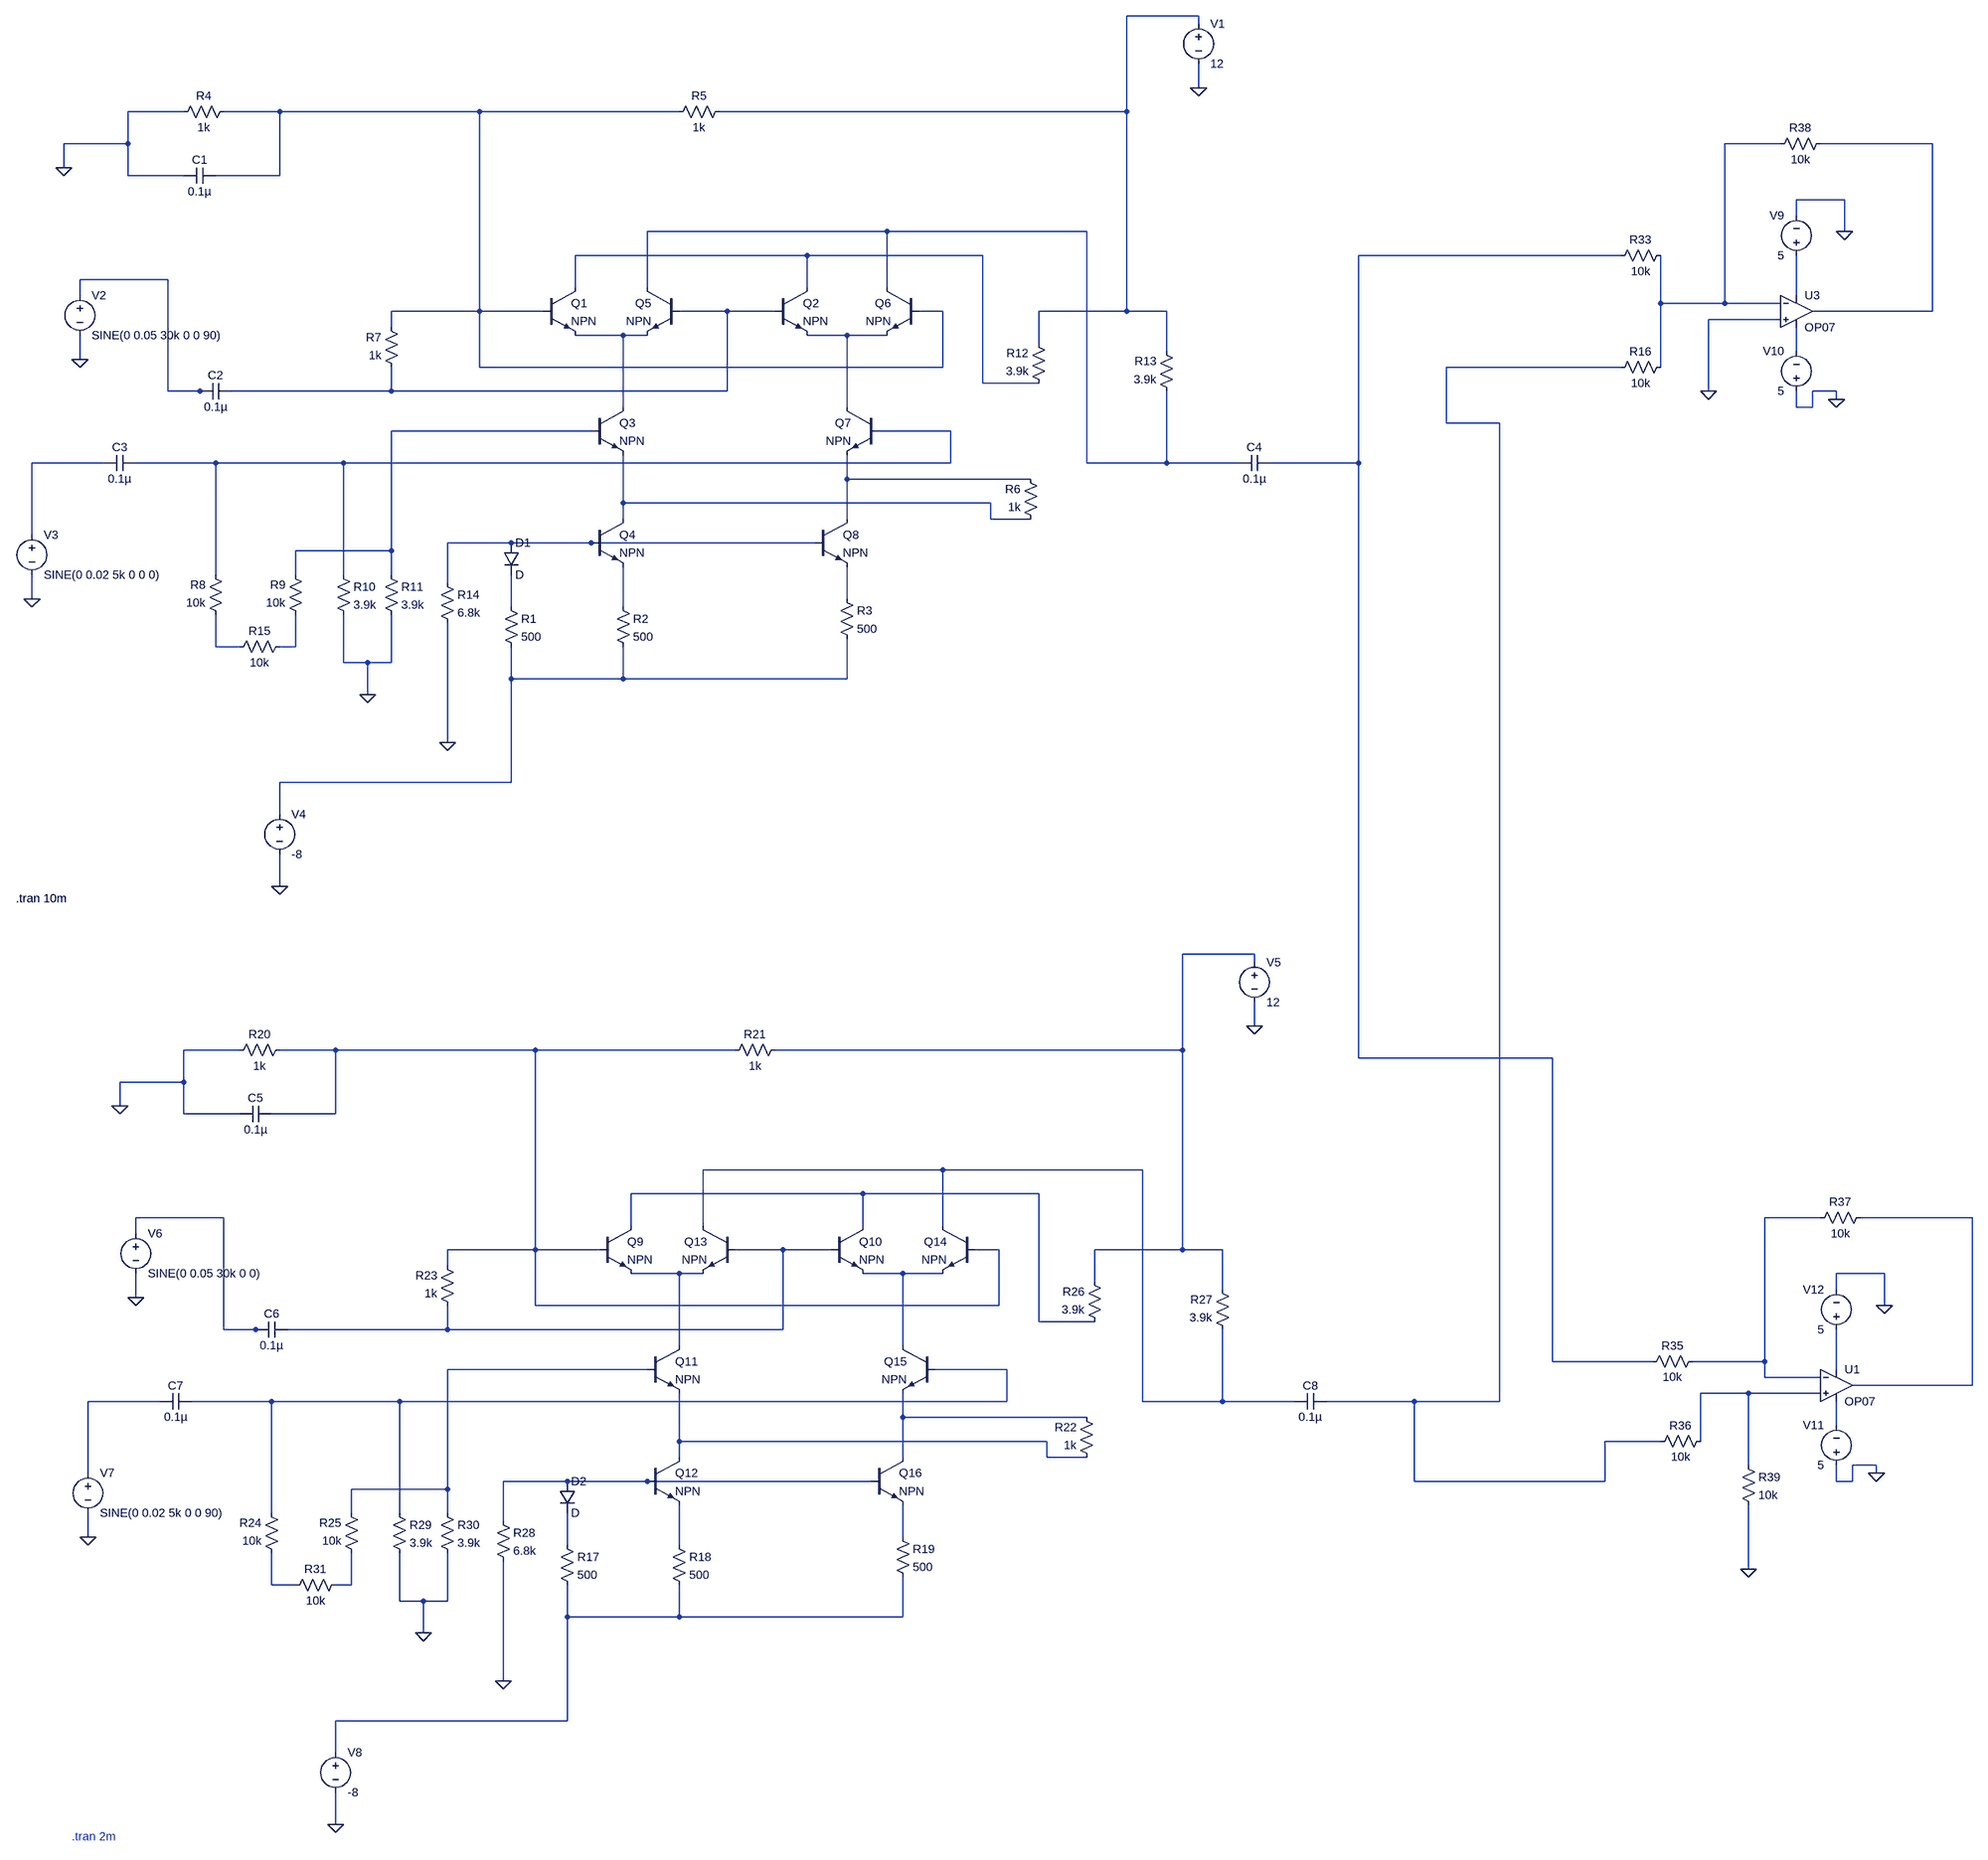
[diagram p0: schematic SSB-SC modulation and demodulation.asc]
SSB-SC modulation and demodulation.asc, the LTspice schematic file:
Version 4
SHEET 1 8160 3920
WIRE 1216 -1008 1072 -1008
WIRE 1216 -992 1216 -1008
WIRE 1216 -864 1216 -912
WIRE -816 -816 -928 -816
WIRE -624 -816 -736 -816
WIRE -224 -816 -624 -816
WIRE 176 -816 -224 -816
WIRE 1072 -816 1072 -1008
WIRE 1072 -816 256 -816
WIRE -928 -752 -928 -816
WIRE -928 -752 -1056 -752
WIRE 2528 -752 2416 -752
WIRE 2832 -752 2608 -752
WIRE -1056 -704 -1056 -752
WIRE -928 -688 -928 -752
WIRE -816 -688 -928 -688
WIRE -624 -688 -624 -816
WIRE -624 -688 -752 -688
WIRE 2656 -640 2560 -640
WIRE 2560 -608 2560 -640
WIRE 592 -576 112 -576
WIRE 992 -576 592 -576
WIRE 2656 -576 2656 -640
WIRE 432 -528 -32 -528
WIRE 784 -528 432 -528
WIRE 2208 -528 1536 -528
WIRE -848 -480 -1024 -480
WIRE -32 -464 -32 -528
WIRE 112 -464 112 -576
WIRE 432 -464 432 -528
WIRE 592 -464 592 -576
WIRE -1024 -448 -1024 -480
WIRE 2560 -448 2560 -528
WIRE 2288 -432 2288 -528
WIRE 2416 -432 2416 -752
WIRE 2416 -432 2288 -432
WIRE 2528 -432 2416 -432
WIRE -224 -416 -224 -816
WIRE -224 -416 -400 -416
WIRE -96 -416 -224 -416
WIRE 272 -416 176 -416
WIRE 368 -416 272 -416
WIRE 704 -416 656 -416
WIRE 1072 -416 1072 -816
WIRE 1072 -416 896 -416
WIRE 1152 -416 1072 -416
WIRE 2832 -416 2832 -752
WIRE 2832 -416 2592 -416
WIRE 2528 -400 2384 -400
WIRE -400 -384 -400 -416
WIRE 64 -368 -32 -368
WIRE 112 -368 64 -368
WIRE 512 -368 432 -368
WIRE 592 -368 512 -368
WIRE 896 -352 896 -416
WIRE 1152 -336 1152 -416
WIRE 2560 -336 2560 -384
WIRE -1024 -320 -1024 -368
WIRE -224 -304 -224 -416
WIRE 704 -304 704 -416
WIRE 704 -304 -224 -304
WIRE 2208 -304 1712 -304
WIRE 2288 -304 2288 -432
WIRE 784 -272 784 -528
WIRE 896 -272 784 -272
WIRE -848 -256 -848 -480
WIRE -784 -256 -848 -256
WIRE -768 -256 -784 -256
WIRE -400 -256 -400 -304
WIRE -400 -256 -720 -256
WIRE 272 -256 272 -416
WIRE 272 -256 -400 -256
WIRE 2384 -256 2384 -400
WIRE 2640 -256 2592 -256
WIRE 2640 -240 2640 -256
WIRE 64 -224 64 -368
WIRE 512 -224 512 -368
WIRE 2560 -224 2560 -256
WIRE 2592 -224 2592 -256
WIRE 2592 -224 2560 -224
WIRE 1712 -192 1712 -304
WIRE 1872 -192 1712 -192
WIRE 0 -176 -400 -176
WIRE 720 -176 576 -176
WIRE -976 -112 -1120 -112
WIRE -752 -112 -912 -112
WIRE -496 -112 -752 -112
WIRE 720 -112 720 -176
WIRE 720 -112 -496 -112
WIRE 992 -112 992 -576
WIRE 1152 -112 1152 -256
WIRE 1152 -112 992 -112
WIRE 1296 -112 1152 -112
WIRE 1536 -112 1536 -528
WIRE 1536 -112 1360 -112
WIRE 512 -80 512 -128
WIRE 880 -80 512 -80
WIRE 64 -32 64 -128
WIRE 800 -32 64 -32
WIRE 64 0 64 -32
WIRE 512 0 512 -80
WIRE 800 0 800 -32
WIRE 880 0 800 0
WIRE -1120 32 -1120 -112
WIRE -160 48 -288 48
WIRE 0 48 -160 48
WIRE 448 48 0 48
WIRE -400 64 -400 -176
WIRE -400 64 -592 64
WIRE -752 112 -752 -112
WIRE -592 112 -592 64
WIRE -496 112 -496 -112
WIRE -400 112 -400 64
WIRE -288 128 -288 48
WIRE -1120 160 -1120 112
WIRE 512 160 512 96
WIRE -160 176 -160 112
WIRE 64 176 64 96
WIRE -752 256 -752 192
WIRE -704 256 -752 256
WIRE -592 256 -592 192
WIRE -592 256 -624 256
WIRE -496 288 -496 192
WIRE -448 288 -496 288
WIRE -400 288 -400 192
WIRE -400 288 -448 288
WIRE -160 320 -160 256
WIRE 64 320 64 256
WIRE 64 320 -160 320
WIRE 512 320 512 240
WIRE 512 320 64 320
WIRE -448 352 -448 288
WIRE -288 448 -288 208
WIRE -160 528 -160 320
WIRE -160 528 -624 528
WIRE -624 592 -624 528
WIRE -624 736 -624 672
WIRE 1328 944 1184 944
WIRE 1328 960 1328 944
WIRE 1328 1088 1328 1040
WIRE -704 1136 -816 1136
WIRE -512 1136 -624 1136
WIRE -112 1136 -512 1136
WIRE 288 1136 -112 1136
WIRE 1184 1136 1184 944
WIRE 1184 1136 368 1136
WIRE 1536 1152 1536 -112
WIRE 2048 1152 1536 1152
WIRE -816 1200 -816 1136
WIRE -816 1200 -944 1200
WIRE -944 1248 -944 1200
WIRE -816 1264 -816 1200
WIRE -704 1264 -816 1264
WIRE -512 1264 -512 1136
WIRE -512 1264 -640 1264
WIRE 704 1376 224 1376
WIRE 1104 1376 704 1376
WIRE 544 1424 80 1424
WIRE 896 1424 544 1424
WIRE -736 1472 -912 1472
WIRE 2608 1472 2496 1472
WIRE 2912 1472 2688 1472
WIRE 80 1488 80 1424
WIRE 224 1488 224 1376
WIRE 544 1488 544 1424
WIRE 704 1488 704 1376
WIRE -912 1504 -912 1472
WIRE -112 1536 -112 1136
WIRE -112 1536 -288 1536
WIRE 16 1536 -112 1536
WIRE 384 1536 288 1536
WIRE 480 1536 384 1536
WIRE 816 1536 768 1536
WIRE 1184 1536 1184 1136
WIRE 1184 1536 1008 1536
WIRE 1264 1536 1184 1536
WIRE -288 1568 -288 1536
WIRE 176 1584 80 1584
WIRE 224 1584 176 1584
WIRE 624 1584 544 1584
WIRE 704 1584 624 1584
WIRE 2736 1584 2640 1584
WIRE 1008 1600 1008 1536
WIRE 1264 1616 1264 1536
WIRE 2640 1616 2640 1584
WIRE -912 1632 -912 1584
WIRE -112 1648 -112 1536
WIRE 816 1648 816 1536
WIRE 816 1648 -112 1648
WIRE 2736 1648 2736 1584
WIRE 896 1680 896 1424
WIRE 1008 1680 896 1680
WIRE -736 1696 -736 1472
WIRE -672 1696 -736 1696
WIRE -656 1696 -672 1696
WIRE -288 1696 -288 1648
WIRE -288 1696 -608 1696
WIRE 384 1696 384 1536
WIRE 384 1696 -288 1696
WIRE 176 1728 176 1584
WIRE 624 1728 624 1584
WIRE 2048 1760 2048 1152
WIRE 2272 1760 2048 1760
WIRE 2496 1760 2496 1472
WIRE 2496 1760 2352 1760
WIRE 112 1776 -288 1776
WIRE 832 1776 688 1776
WIRE 2640 1776 2640 1696
WIRE 2496 1792 2496 1760
WIRE 2608 1792 2496 1792
WIRE 2912 1808 2912 1472
WIRE 2912 1808 2672 1808
WIRE 2464 1824 2368 1824
WIRE 2608 1824 2464 1824
WIRE -864 1840 -1008 1840
WIRE -640 1840 -800 1840
WIRE -384 1840 -640 1840
WIRE 832 1840 832 1776
WIRE 832 1840 -384 1840
WIRE 1104 1840 1104 1376
WIRE 1264 1840 1264 1696
WIRE 1264 1840 1104 1840
WIRE 1408 1840 1264 1840
WIRE 1648 1840 1472 1840
WIRE 1872 1840 1872 -192
WIRE 1872 1840 1648 1840
WIRE 624 1872 624 1824
WIRE 992 1872 624 1872
WIRE 2640 1888 2640 1840
WIRE 176 1920 176 1824
WIRE 912 1920 176 1920
WIRE 2288 1920 2176 1920
WIRE 2368 1920 2368 1824
WIRE 176 1952 176 1920
WIRE 624 1952 624 1872
WIRE 912 1952 912 1920
WIRE 992 1952 912 1952
WIRE 2464 1968 2464 1824
WIRE 2720 1968 2672 1968
WIRE -1008 1984 -1008 1840
WIRE 2720 1984 2720 1968
WIRE -48 2000 -176 2000
WIRE 112 2000 -48 2000
WIRE 560 2000 112 2000
WIRE 1648 2000 1648 1840
WIRE 2176 2000 2176 1920
WIRE 2176 2000 1648 2000
WIRE 2640 2000 2640 1968
WIRE 2672 2000 2672 1968
WIRE 2672 2000 2640 2000
WIRE -288 2016 -288 1776
WIRE -288 2016 -480 2016
WIRE -640 2064 -640 1840
WIRE -480 2064 -480 2016
WIRE -384 2064 -384 1840
WIRE -288 2064 -288 2016
WIRE -176 2080 -176 2000
WIRE -1008 2112 -1008 2064
WIRE 624 2112 624 2048
WIRE -48 2128 -48 2064
WIRE 176 2128 176 2048
WIRE 2464 2176 2464 2048
WIRE -640 2208 -640 2144
WIRE -592 2208 -640 2208
WIRE -480 2208 -480 2144
WIRE -480 2208 -512 2208
WIRE -384 2240 -384 2144
WIRE -336 2240 -384 2240
WIRE -288 2240 -288 2144
WIRE -288 2240 -336 2240
WIRE -48 2272 -48 2208
WIRE 176 2272 176 2208
WIRE 176 2272 -48 2272
WIRE 624 2272 624 2192
WIRE 624 2272 176 2272
WIRE -336 2304 -336 2240
WIRE -176 2400 -176 2160
WIRE -48 2480 -48 2272
WIRE -48 2480 -512 2480
WIRE -512 2544 -512 2480
WIRE -512 2688 -512 2624
FLAG -288 448 0
FLAG -448 352 0
FLAG 1216 -864 0
FLAG -1024 -320 0
FLAG -1120 160 0
FLAG -1056 -704 0
FLAG -624 736 0
FLAG -176 2400 0
FLAG -336 2304 0
FLAG 1328 1088 0
FLAG -912 1632 0
FLAG -1008 2112 0
FLAG -944 1248 0
FLAG -512 2688 0
FLAG 2656 -576 0
FLAG 2640 -240 0
FLAG 2384 -256 0
FLAG 2736 1648 0
FLAG 2720 1984 0
FLAG 2464 2176 0
SYMBOL npn -96 -464 R0
SYMATTR InstName Q1
SYMBOL npn 368 -464 R0
SYMATTR InstName Q2
SYMBOL npn 0 -224 R0
SYMATTR InstName Q3
SYMBOL npn 0 0 R0
SYMATTR InstName Q4
SYMBOL npn 176 -464 M0
SYMATTR InstName Q5
SYMBOL npn 656 -464 M0
SYMATTR InstName Q6
SYMBOL npn 576 -224 M0
SYMATTR InstName Q7
SYMBOL diode -176 48 R0
SYMATTR InstName D1
SYMBOL res -176 160 R0
SYMATTR InstName R1
SYMATTR Value 500
SYMBOL res 48 160 R0
SYMATTR InstName R2
SYMATTR Value 500
SYMBOL npn 448 0 R0
SYMATTR InstName Q8
SYMBOL res 496 144 R0
SYMATTR InstName R3
SYMATTR Value 500
SYMBOL res -720 -832 R90
WINDOW 0 0 56 VBottom 2
WINDOW 3 32 56 VTop 2
SYMATTR InstName R4
SYMATTR Value 1k
SYMBOL res 272 -832 R90
WINDOW 0 0 56 VBottom 2
WINDOW 3 32 56 VTop 2
SYMATTR InstName R5
SYMATTR Value 1k
SYMBOL res 896 16 R180
WINDOW 0 36 76 Left 2
WINDOW 3 36 40 Left 2
SYMATTR InstName R6
SYMATTR Value 1k
SYMBOL res -384 -288 R180
WINDOW 0 36 76 Left 2
WINDOW 3 36 40 Left 2
SYMATTR InstName R7
SYMATTR Value 1k
SYMBOL res -736 208 R180
WINDOW 0 36 76 Left 2
WINDOW 3 36 40 Left 2
SYMATTR InstName R8
SYMATTR Value 10k
SYMBOL res -576 208 R180
WINDOW 0 36 76 Left 2
WINDOW 3 36 40 Left 2
SYMATTR InstName R9
SYMATTR Value 10k
SYMBOL res 912 -256 R180
WINDOW 0 36 76 Left 2
WINDOW 3 36 40 Left 2
SYMATTR InstName R12
SYMATTR Value 3.9k
SYMBOL res 1168 -240 R180
WINDOW 0 36 76 Left 2
WINDOW 3 36 40 Left 2
SYMATTR InstName R13
SYMATTR Value 3.9k
SYMBOL cap -752 -704 R90
WINDOW 0 0 32 VBottom 2
WINDOW 3 32 32 VTop 2
SYMATTR InstName C1
SYMATTR Value 0.1µ
SYMBOL cap -720 -272 R90
WINDOW 0 0 32 VBottom 2
WINDOW 3 32 32 VTop 2
SYMATTR InstName C2
SYMATTR Value 0.1µ
SYMBOL cap -912 -128 R90
WINDOW 0 0 32 VBottom 2
WINDOW 3 32 32 VTop 2
SYMATTR InstName C3
SYMATTR Value 0.1µ
SYMBOL cap 1360 -128 R90
WINDOW 0 0 32 VBottom 2
WINDOW 3 32 32 VTop 2
SYMATTR InstName C4
SYMATTR Value 0.1µ
SYMBOL res -304 112 R0
SYMATTR InstName R14
SYMATTR Value 6.8k
SYMBOL res -512 96 R0
SYMATTR InstName R10
SYMATTR Value 3.9k
SYMBOL res -416 96 R0
SYMATTR InstName R11
SYMATTR Value 3.9k
SYMBOL voltage 1216 -1008 R0
WINDOW 123 0 0 Left 0
WINDOW 39 0 0 Left 0
SYMATTR InstName V1
SYMATTR Value 12
SYMBOL voltage -1024 -464 R0
WINDOW 123 0 0 Left 0
WINDOW 39 0 0 Left 0
SYMATTR InstName V2
SYMATTR Value SINE(0 0.05 30k 0 0 90)
SYMBOL voltage -1120 16 R0
WINDOW 123 0 0 Left 0
WINDOW 39 0 0 Left 0
SYMATTR InstName V3
SYMATTR Value SINE(0 0.02 5k 0 0 0)
SYMBOL res -608 240 R90
WINDOW 0 0 56 VBottom 2
WINDOW 3 32 56 VTop 2
SYMATTR InstName R15
SYMATTR Value 10k
SYMBOL voltage -624 576 R0
WINDOW 123 0 0 Left 0
WINDOW 39 0 0 Left 0
SYMATTR InstName V4
SYMATTR Value -8
SYMBOL npn 16 1488 R0
SYMATTR InstName Q9
SYMBOL npn 480 1488 R0
SYMATTR InstName Q10
SYMBOL npn 112 1728 R0
SYMATTR InstName Q11
SYMBOL npn 112 1952 R0
SYMATTR InstName Q12
SYMBOL npn 288 1488 M0
SYMATTR InstName Q13
SYMBOL npn 768 1488 M0
SYMATTR InstName Q14
SYMBOL npn 688 1728 M0
SYMATTR InstName Q15
SYMBOL diode -64 2000 R0
SYMATTR InstName D2
SYMBOL res -64 2112 R0
SYMATTR InstName R17
SYMATTR Value 500
SYMBOL res 160 2112 R0
SYMATTR InstName R18
SYMATTR Value 500
SYMBOL npn 560 1952 R0
SYMATTR InstName Q16
SYMBOL res 608 2096 R0
SYMATTR InstName R19
SYMATTR Value 500
SYMBOL res -608 1120 R90
WINDOW 0 0 56 VBottom 2
WINDOW 3 32 56 VTop 2
SYMATTR InstName R20
SYMATTR Value 1k
SYMBOL res 384 1120 R90
WINDOW 0 0 56 VBottom 2
WINDOW 3 32 56 VTop 2
SYMATTR InstName R21
SYMATTR Value 1k
SYMBOL res 1008 1968 R180
WINDOW 0 36 76 Left 2
WINDOW 3 36 40 Left 2
SYMATTR InstName R22
SYMATTR Value 1k
SYMBOL res -272 1664 R180
WINDOW 0 36 76 Left 2
WINDOW 3 36 40 Left 2
SYMATTR InstName R23
SYMATTR Value 1k
SYMBOL res -624 2160 R180
WINDOW 0 36 76 Left 2
WINDOW 3 36 40 Left 2
SYMATTR InstName R24
SYMATTR Value 10k
SYMBOL res -464 2160 R180
WINDOW 0 36 76 Left 2
WINDOW 3 36 40 Left 2
SYMATTR InstName R25
SYMATTR Value 10k
SYMBOL res 1024 1696 R180
WINDOW 0 36 76 Left 2
WINDOW 3 36 40 Left 2
SYMATTR InstName R26
SYMATTR Value 3.9k
SYMBOL res 1280 1712 R180
WINDOW 0 36 76 Left 2
WINDOW 3 36 40 Left 2
SYMATTR InstName R27
SYMATTR Value 3.9k
SYMBOL cap -640 1248 R90
WINDOW 0 0 32 VBottom 2
WINDOW 3 32 32 VTop 2
SYMATTR InstName C5
SYMATTR Value 0.1µ
SYMBOL cap -608 1680 R90
WINDOW 0 0 32 VBottom 2
WINDOW 3 32 32 VTop 2
SYMATTR InstName C6
SYMATTR Value 0.1µ
SYMBOL cap -800 1824 R90
WINDOW 0 0 32 VBottom 2
WINDOW 3 32 32 VTop 2
SYMATTR InstName C7
SYMATTR Value 0.1µ
SYMBOL cap 1472 1824 R90
WINDOW 0 0 32 VBottom 2
WINDOW 3 32 32 VTop 2
SYMATTR InstName C8
SYMATTR Value 0.1µ
SYMBOL res -192 2064 R0
SYMATTR InstName R28
SYMATTR Value 6.8k
SYMBOL res -400 2048 R0
SYMATTR InstName R29
SYMATTR Value 3.9k
SYMBOL res -304 2048 R0
SYMATTR InstName R30
SYMATTR Value 3.9k
SYMBOL voltage 1328 944 R0
WINDOW 123 0 0 Left 0
WINDOW 39 0 0 Left 0
SYMATTR InstName V5
SYMATTR Value 12
SYMBOL voltage -912 1488 R0
WINDOW 123 0 0 Left 0
WINDOW 39 0 0 Left 0
SYMATTR InstName V6
SYMATTR Value SINE(0 0.05 30k 0 0)
SYMBOL voltage -1008 1968 R0
WINDOW 123 0 0 Left 0
WINDOW 39 0 0 Left 0
SYMATTR InstName V7
SYMATTR Value SINE(0 0.02 5k 0 0 90)
SYMBOL res -496 2192 R90
WINDOW 0 0 56 VBottom 2
WINDOW 3 32 56 VTop 2
SYMATTR InstName R31
SYMATTR Value 10k
SYMBOL voltage -512 2528 R0
WINDOW 123 0 0 Left 0
WINDOW 39 0 0 Left 0
SYMATTR InstName V8
SYMATTR Value -8
SYMBOL OpAmps\\OP07 2560 -480 R0
SYMATTR InstName U3
SYMBOL res 2192 -512 R270
WINDOW 0 32 56 VTop 2
WINDOW 3 0 56 VBottom 2
SYMATTR InstName R33
SYMATTR Value 10k
SYMBOL res 2624 -768 R90
WINDOW 0 0 56 VBottom 2
WINDOW 3 32 56 VTop 2
SYMATTR InstName R38
SYMATTR Value 10k
SYMBOL voltage 2560 -240 R180
WINDOW 0 24 96 Left 2
WINDOW 3 24 16 Left 2
WINDOW 123 0 0 Left 0
WINDOW 39 0 0 Left 0
SYMATTR InstName V10
SYMATTR Value 5
SYMBOL voltage 2560 -512 R180
WINDOW 0 24 96 Left 2
WINDOW 3 24 16 Left 2
WINDOW 123 0 0 Left 0
WINDOW 39 0 0 Left 0
SYMATTR InstName V9
SYMATTR Value 5
SYMBOL OpAmps\\OP07 2640 1744 R0
SYMATTR InstName U1
SYMBOL res 2384 1904 R90
WINDOW 0 0 56 VBottom 2
WINDOW 3 32 56 VTop 2
SYMATTR InstName R36
SYMATTR Value 10k
SYMBOL res 2704 1456 R90
WINDOW 0 0 56 VBottom 2
WINDOW 3 32 56 VTop 2
SYMATTR InstName R37
SYMATTR Value 10k
SYMBOL voltage 2640 1984 R180
WINDOW 0 24 96 Left 2
WINDOW 3 24 16 Left 2
WINDOW 123 0 0 Left 0
WINDOW 39 0 0 Left 0
SYMATTR InstName V11
SYMATTR Value 5
SYMBOL voltage 2640 1712 R180
WINDOW 0 24 96 Left 2
WINDOW 3 24 16 Left 2
WINDOW 123 0 0 Left 0
WINDOW 39 0 0 Left 0
SYMATTR InstName V12
SYMATTR Value 5
SYMBOL res 2368 1744 R90
WINDOW 0 0 56 VBottom 2
WINDOW 3 32 56 VTop 2
SYMATTR InstName R35
SYMATTR Value 10k
SYMBOL res 2448 1952 R0
SYMATTR InstName R39
SYMATTR Value 10k
SYMBOL res 2304 -320 R90
WINDOW 0 0 56 VBottom 2
WINDOW 3 32 56 VTop 2
SYMATTR InstName R16
SYMATTR Value 10k
TEXT -1152 760 Left 2 !.tran 10m
TEXT -1040 2712 Left 2 ;.tran 2m

The netlist it stands for:
* SSB-SC modulation and demodulation.asc
Q1 N006 N002 N011 0 NPN
Q2 N006 N010 N012 0 NPN
Q3 N011 N015 N019 0 NPN
Q4 N019 N020 N023 0 NPN
Q5 N005 N010 N011 0 NPN
Q6 N005 N002 N012 0 NPN
Q7 N012 N016 N018 0 NPN
D1 N020 N022 D
R1 N022 N026 500
R2 N023 N026 500
Q8 N018 N020 N021 0 NPN
R3 N021 N026 500
R4 N002 0 1k
R5 N001 N002 1k
R6 N019 N018 1k
R7 N010 N002 1k
R8 N024 N016 10k
R9 N025 N015 10k
R12 N006 N001 3.9k
R13 N005 N001 3.9k
C1 N002 0 0.1µ
C2 N010 N008 0.1µ
C3 N016 N017 0.1µ
C4 N007 N005 0.1µ
R14 N020 0 6.8k
R10 N016 0 3.9k
R11 N015 0 3.9k
V1 N001 0 12
V2 N008 0 SINE(0 0.05 30k 0 0 90)
V3 N017 0 SINE(0 0.02 5k 0 0 0)
R15 N025 N024 10k
V4 N026 0 -8
Q9 N030 N028 N035 0 NPN
Q10 N030 N034 N036 0 NPN
Q11 N035 N037 N044 0 NPN
Q12 N044 N045 N048 0 NPN
Q13 N029 N034 N035 0 NPN
Q14 N029 N028 N036 0 NPN
Q15 N036 N038 N042 0 NPN
D2 N045 N047 D
R17 N047 N051 500
R18 N048 N051 500
Q16 N042 N045 N046 0 NPN
R19 N046 N051 500
R20 N028 0 1k
R21 N027 N028 1k
R22 N044 N042 1k
R23 N034 N028 1k
R24 N049 N038 10k
R25 N050 N037 10k
R26 N030 N027 3.9k
R27 N029 N027 3.9k
C5 N028 0 0.1µ
C6 N034 N031 0.1µ
C7 N038 N041 0.1µ
C8 N014 N029 0.1µ
R28 N045 0 6.8k
R29 N038 0 3.9k
R30 N037 0 3.9k
V5 N027 0 12
V6 N031 0 SINE(0 0.05 30k 0 0)
V7 N041 0 SINE(0 0.02 5k 0 0 90)
R31 N050 N049 10k
V8 N051 0 -8
XU3 0 N003 N009 N013 N004 LT1001  ; OP07, pins In+ In- V+ V- OUT
R33 N007 N003 10k
R38 N004 N003 10k
V10 0 N013 5
V9 N009 0 5
XU1 N040 N032 N039 N043 N033 LT1001  ; OP07, pins In+ In- V+ V- OUT
R36 N040 N014 10k
R37 N033 N032 10k
V11 0 N043 5
V12 N039 0 5
R35 N032 N007 10k
R39 N040 0 10k
R16 N003 N014 10k
.model D D
.lib standard.dio
.model NPN NPN
.model PNP PNP
.lib standard.bjt
.tran 10m
* .tran 2m
.lib LTC.lib
.backanno
.end